# Altium schematic sheet Connector_Section.SchDoc
size A4; DocumentNumber: 6; SheetNumber: 6; SheetTotal: 6
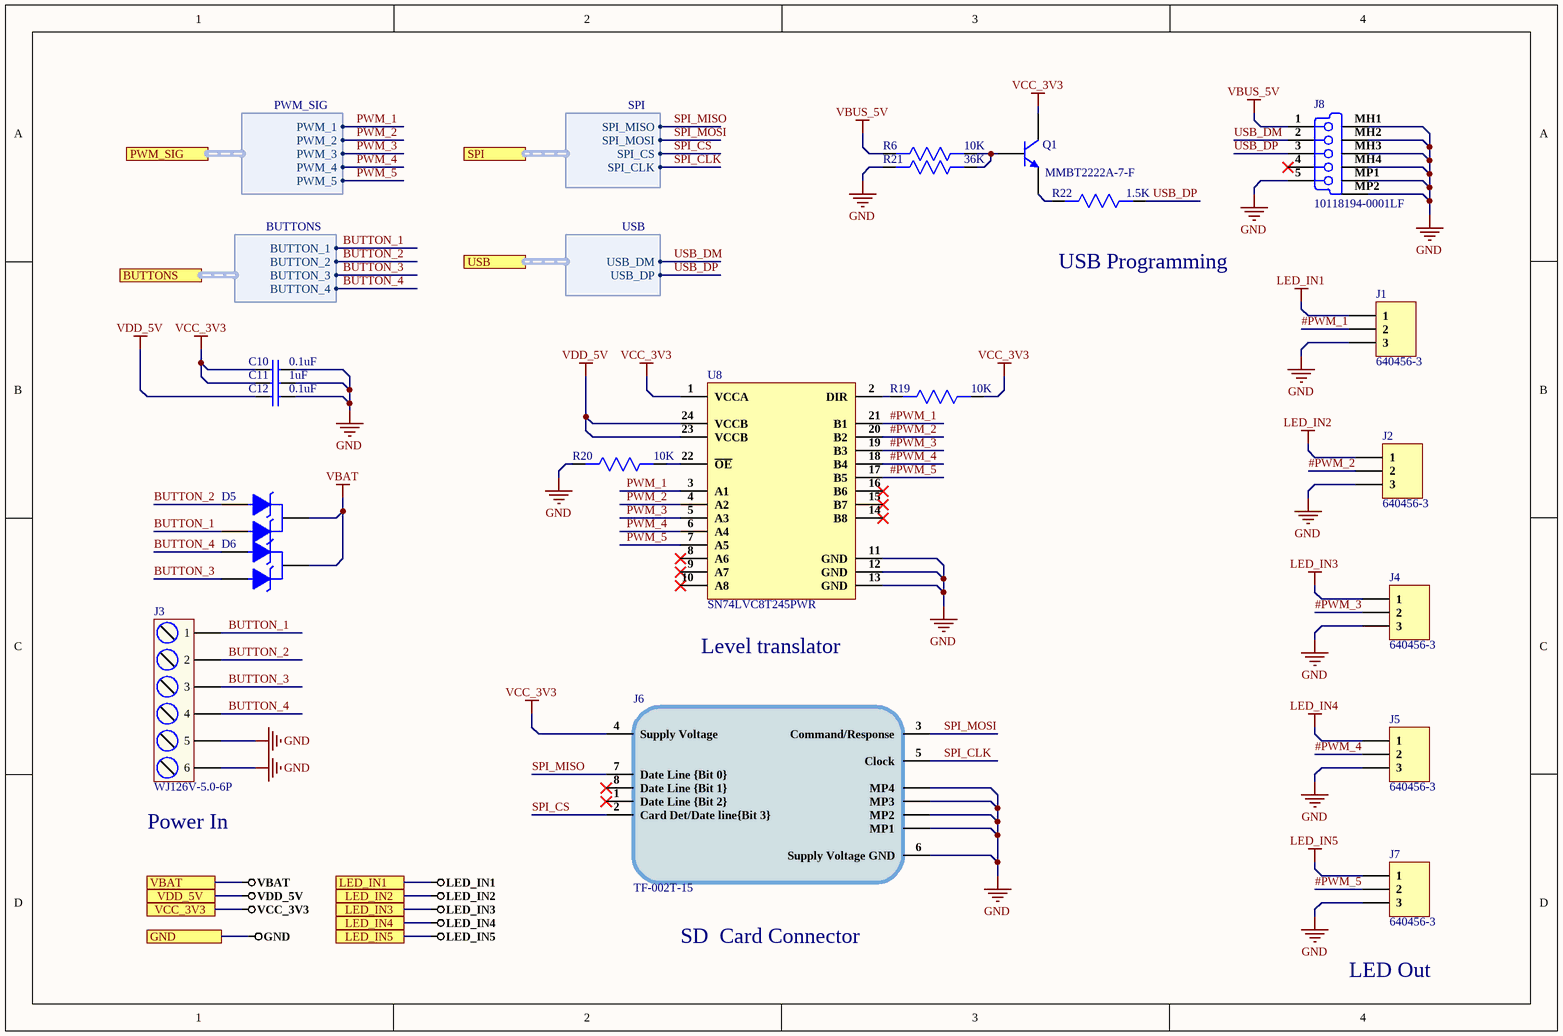
[diagram p0: Connector_Section.SchDoc]

## Parts
C10  0.1uF  [Cap0603]
C11  1uF  [Cap0603]
C12  0.1uF  [Cap0603]
D5  VS-12CWQ06FNTR-M3  [VS-12CWQ06FNTR-M3]  (value not drawn)
D6  VS-12CWQ06FNTR-M3  [VS-12CWQ06FNTR-M3]  (value not drawn)
J1  640456-3  [640456-3]
J2  640456-3  [640456-3]
J3  WJ126V-5.0-6P  [WJ126V-5.0-6P]
J4  640456-3  [640456-3]
J5  640456-3  [640456-3]
J6  TF-002T-15  [TF-002T-15]
J7  640456-3  [640456-3]
J8  10118194-0001LF  [10118194-0001LF]
Q1  MMBT2222A-7-F  [SOT-23]
R6  10K  [Res0603]
R19  10K  [Res0603]
R20  10K  [Res0603]
R21  36K  [Res0603]
R22  1.5K  [Res0603]
U8  SN74LVC8T245PWR  [24-TSSOP]

## Ports
BUTTONS (harness BUTTONS), GND, LED_IN1, LED_IN2, LED_IN3, LED_IN4, LED_IN5, PWM_SIG (harness PWM_SIG), SPI (harness SPI), USB (harness USB), VBAT, VCC_3V3, VDD_5V

## Harnesses
PWM_SIG: PWM_1, PWM_2, PWM_3, PWM_4, PWM_5
SPI: SPI_MISO, SPI_MOSI, SPI_CS, SPI_CLK
USB: USB_DM, USB_DP
BUTTONS: BUTTON_1, BUTTON_2, BUTTON_3, BUTTON_4

## Nets
GND: C10.2 C11.2 C12.2 J1.3 J2.3 J3.5 J3.6 J4.3 J5.3 J6.6(Supply_Voltage_GND) J6.MP1 J6.MP2 J6.MP3 J6.MP4 J7.3 J8.5(GND) J8.MH1(Tab) J8.MH2(Tab) J8.MH3(Tab) J8.MH4(Tab) J8.MP1(Tab) J8.MP2(Tab) R20.2 R21.2 U8.11(GND) U8.12(GND) U8.13(GND) ; port GND
LED_IN1: J1.1 ; port LED_IN1
LED_IN2: J2.1 ; port LED_IN2
LED_IN3: J4.1 ; port LED_IN3
LED_IN4: J5.1 ; port LED_IN4
LED_IN5: J7.1 ; port LED_IN5
VBAT: D5.4(CATHODE) D6.4(CATHODE) ; port VBAT
VBUS_5V: J8.1(V_BUS_(5V)) R6.2
VCC_3V3: C10.1 C11.1 J6.4(Supply_Voltage) Q1.3(C) R19.1 U8.1(VCCA) ; port VCC_3V3
VDD_5V: C12.1 U8.23(VCCB) U8.24(VCCB) ; port VDD_5V
#PWM_1: J1.2 U8.21(B1)
#PWM_2: J2.2 U8.20(B2)
#PWM_3: J4.2 U8.19(B3)
#PWM_4: J5.2 U8.18(B4)
#PWM_5: J7.2 U8.17(B5)
BUTTON_1: D5.3(ANODE) J3.1 ; port BUTTONS.BUTTON_1
BUTTON_2: D5.1(ANODE) J3.2 ; port BUTTONS.BUTTON_2
BUTTON_3: D6.3(ANODE) J3.3 ; port BUTTONS.BUTTON_3
BUTTON_4: D6.1(ANODE) J3.4 ; port BUTTONS.BUTTON_4
PWM_1: U8.3(A1) ; port PWM_SIG.PWM_1
PWM_2: U8.4(A2) ; port PWM_SIG.PWM_2
PWM_3: U8.5(A3) ; port PWM_SIG.PWM_3
PWM_4: U8.6(A4) ; port PWM_SIG.PWM_4
PWM_5: U8.7(A5) ; port PWM_SIG.PWM_5
SPI_CLK: J6.5(Clock) ; port SPI.SPI_CLK
SPI_CS: J6.2(Card_Det/Date_line{Bit_3}) ; port SPI.SPI_CS
SPI_MISO: J6.7(Date_Line_{Bit_0}) ; port SPI.SPI_MISO
SPI_MOSI: J6.3(Command/Response) ; port SPI.SPI_MOSI
USB_DM: J8.2(D-) ; port USB.USB_DM
USB_DP: J8.3(D+) R22.1 ; port USB.USB_DP
NetQ1_1: Q1.1(B) R6.1 R21.1
NetQ1_2: Q1.2(E) R22.2
NetR19_2: R19.2 U8.2(DIR)
NetR20_1: R20.1 U8.22(~{OE})

Not connected (* = marked no-connect by the designer): J6 1(Date_Line_{Bit_2})* 8(Date_Line_{Bit_1})*; J8 4(NC)*; U8 8(A6)* 9(A7)* 10(A8)* 14(B8)* 15(B7)* 16(B6)*

## Notes on the sheet
- (near R22) USB Programming
- Level translator
- (near J3) Power In
- SD  Card Connector
- LED Out

## Library data of the parts
C10 C12 = CC0603KRX7R0BB104: CAP CER 0.1UF 100V X7R 0603; Manufacturer: Yageo; Capacitance: 100nF; Tolerance: 10%; Supplier 1: Digi-Key; Manufacturer Part Number: CC0603KRX7R0BB104; RoHS: Yes; Category: Ceramic Capacitors; Stock 1: 60476; Pricing 1: 1=0.19000, 10=0.13500, 50=0.07680, 100=0.06370, 500=0.04466, 1000=0.03696 (USD); Mount: Surface Mount; Case/Package: 0603; Case Code (Metric): 1608; Case Code (Imperial): 0603; Weight: 7.1E-05oz; Min Operating Temperature: -55°C; Max Operating Temperature: 125°C; Package Quantity: 4000; Voltage Rating: 100V; Packaging: Tape and Reel; Dielectric: X7R; Termination: SMD/SMT; Resistor Type: Ceramic; Voltage Rating (DC): 100V; Series: CC; Length: 0.063inch; Width: 0.031inch; Thickness: 0.035inch; Depth: 0.8mm; Lead Free: Lead Free; RoHS Compliant: Yes; ComponentLink1URL: https://datasheet.ciiva.com/6277/mlccorderingcode-6277030.pdf?src-supplier=Digi-Key; ComponentLink1Description: https://datasheet.ciiva.com/6277/mlccorderingcode-6277030.pdf?src-supplier=Digi-Key; ComponentLink2URL: https://datasheet.ciiva.com/6277/mlccorderingcode-6277081.pdf?src-supplier=Digi-Key; ComponentLink2Description: https://datasheet.ciiva.com/6277/mlccorderingcode-6277081.pdf?src-supplier=Digi-Key; ComponentLink3URL: https://datasheet.ciiva.com/6277/mlccorderingcode-6277082.pdf?src-supplier=Digi-Key; ComponentLink3Description: https://datasheet.ciiva.com/6277/mlccorderingcode-6277082.pdf?src-supplier=Digi-Key; Supplier Part Number 1: 311-1523-1-ND
C11 = CC0603KRX5R8BB105: CAP CER 1UF 25V X5R 0603; Manufacturer: Yageo; Tolerance: 10%; Supplier 1: Digi-Key; Manufacturer Part Number: CC0603KRX5R8BB105; Stock 1: 277068; Pricing 1: 1=0.13, 10=0.093, 100=0.0437, 500=0.03066, 1000=0.02539 (USD); Mount: Surface Mount; Case/Package: 0603; Number of Pins: 2; Case Code (Metric): 1608; Case Code (Imperial): 0603; Min Operating Temperature: -55°C; Max Operating Temperature: 85°C; Capacitance: 1uF; Dielectric: X5R; Package Quantity: 1; Voltage Rating: 25V; Packaging: Tape and Reel; Termination: SMD/SMT; Voltage Rating (DC): 25V; Length: 1.6mm; Height: 0.8mm; Width: 0.031inch; Thickness: 0.035inch; Depth: 0.8mm; Radiation Hardening: No; REACH SVHC: No SVHC; Lead Free: Lead Free; Halogen Free: Halogen Free; ComponentLink1URL: http://www.yageo.com/documents/recent/UPY-GPHC_X5R_4V-to-50V_25.pdf?src-supplier=Digi-Key; ComponentLink1Description: http://www.yageo.com/documents/recent/UPY-GPHC_X5R_4V-to-50V_25.pdf?src-supplier=Digi-Key; ComponentLink2URL: http://www.yageo.com/documents/recent/UPY-GPHC_X5R_4V-to-50V_12.pdf?src-supplier=Avnet+Europe; ComponentLink2Description: http://www.yageo.com/documents/recent/UPY-GPHC_X5R_4V-to-50V_12.pdf?src-supplier=Avnet+Europe; ComponentLink3URL: http://www.farnell.com/datasheets/1525783.pdf?src-supplier=Element14; ComponentLink3Description: http://www.farnell.com/datasheets/1525783.pdf?src-supplier=Element14; ComponentLink4URL: http://www.yageo.com/documents/recent/UPY-GPHC_X5R_4V-to-50V_12.pdf?src-supplier=Avnet; ComponentLink4Description: http://www.yageo.com/documents/recent/UPY-GPHC_X5R_4V-to-50V_12.pdf?src-supplier=Avnet; Supplier Part Number 1: 311-1445-6-ND
D5 D6 = VS-12CWQ06FNTR-M3: Schottky Rectifier, 60 V, 12 A, Dual Common Cathode, TO-252AA; Manufacturer: Vishay Semiconductors; Forward Voltage: 790mV; Forward Current: 12A; Max Reverse Current: 3mA; Average Rectified Current: 6A; Max Repetitive Reverse Voltage (Vrrm): 60V; Peak Non-Repetitive Surge Current: 320A; Supplier 1: Avnet; Manufacturer Part Number: VS-12CWQ06FNTR-M3; RoHS: Yes; Category: Rectifier Diodes; Stock 1: 119; Pricing 1: 1=1.14000, 10=1.03000, 25=0.97800, 50=0.92000, 100=0.86500, 250=0.81400, 500=0.77000 (USD); Mount: Surface Mount; Case/Package: TO-252AA; Number of Pins: 3; Min Operating Temperature: -55°C; Max Operating Temperature: 150°C; Packaging: Tape and Reel; Element Configuration: Common Cathode; Max Forward Surge Current (Ifsm): 320A; Max Reverse Voltage (DC): 60V; Series: -; REACH SVHC: No SVHC; RoHS Compliant: Yes; ComponentLink1URL: https://datasheet.ciiva.com/8289/12cwq06f-8289149.pdf?src-supplier=Avnet; ComponentLink1Description: https://datasheet.ciiva.com/8289/12cwq06f-8289149.pdf?src-supplier=Avnet; Supplier Part Number 1: 99Y8339
J1 J2 J4 J5 J7 = 640456-3: CONN HEADER VERT 3POS 2.54MM; Manufacturer: TE Connectivity; Number of Positions: 3; Voltage Rating: 250V; Connector Type: Connector,Pin,Plug,Header; Connector System: Wire-to-Board; Contact Retention: No (Without); Contact Current Rating: 5A; PCB Mount Retention: Without; Contact Resistance: 6mR; PCB Mounting Orientation: Vertical; Gender: Male; Contact Style: Straight; Circuit Application: Signal; Mating Connector Lock: Yes (With); PCB Thickness: 0.063inch; Plating Thickness: 3.81um; Contact Post Length: 3.56mm; Tail Length: 0.14inch; Approvals: CSA; Supplier 1: RSComponents; Manufacturer Part Number: 640456-3; RoHS: Yes; Category: Connectors; Stock 1: 8977; Pricing 1: 250=0.08100, 1000=0.07000, 5000=0.05800, 10000=0.05400 (GBP); Mount: Through Hole; Contact Plating: Tin; Housing Color: Natural; Housing Material: Polyester; Contact Material: Copper Alloy; Color: Beige,White; Contact Shape: Square; Contact Finish - Mating: TIN; Insulation Material: Thermoplastic; Insulation Color: Natural; Min Operating Temperature: -67°C; Max Operating Temperature: 221°C; Number of Rows: 1; Packaging: Bulk; Package Quantity: 5000; Termination: Solder; Number of Contacts: 3; Orientation: Straight; Max Voltage Rating (AC): 250V; Contact Gender: Male; Mating Alignment: No (Without); Mating Retention: No (Without); PCB Mount Alignment: No (Without); Sealable: No (Without); Current Rating: 5A; Strain Relief: No (Without); Backwall/Post Interruptions: No (Without); Shrouded: No (Without); Fastening Type: Friction; Voltage Rating (AC): 250V; Series: MTA-100; Contact Type: Male Pin; Panel Mount Retention: No (Without); Mounting Ears: No (Without); Length: 0.4inch; Height: 7.87mm; Pitch: 2.54mm; Depth: 5.72mm; Contact Mating Length: 7.49mm; Radiation Hardening: No; Flammability Rating: UL94 V-0; REACH SVHC: Unknown; Lead Free: Lead Free; ELV: Compliant; RoHS Compliant: Yes; ComponentLink1URL: https://datasheet.ciiva.com/11746/0900766b80027008-11746172.pdf?src-supplier=RSComponents; ComponentLink1Description: https://datasheet.ciiva.com/11746/0900766b80027008-11746172.pdf?src-supplier=RSComponents; ComponentLink2URL: https://datasheet.ciiva.com/6005/1712135-6005440.pdf?src-supplier=Farnell; ComponentLink2Description: https://datasheet.ciiva.com/6005/1712135-6005440.pdf?src-supplier=Farnell; ComponentLink3URL: https://datasheet.ciiva.com/19474/613940-19474164.pdf?src-supplier=Jameco; ComponentLink3Description: https://datasheet.ciiva.com/19474/613940-19474164.pdf?src-supplier=Jameco; ComponentLink4URL: https://datasheet.ciiva.com/16456/eng-ds-82056-mta-0608-16456886.pdf?src-supplier=Future+Electronics; ComponentLink4Description: https://datasheet.ciiva.com/16456/eng-ds-82056-mta-0608-16456886.pdf?src-supplier=Future+Electronics; ComponentLink5URL: https://datasheet.ciiva.com/14156/04384301-14156821.pdf?src-supplier=Distrelec; ComponentLink5Description: https://datasheet.ciiva.com/14156/04384301-14156821.pdf?src-supplier=Distrelec; ComponentLink6URL: https://datasheet.ciiva.com/16656/eng-ds-82056-mta-0608-16656523.pdf?src-supplier=Avnet+Europe; ComponentLink6Description: https://datasheet.ciiva.com/16656/eng-ds-82056-mta-0608-16656523.pdf?src-supplier=Avnet+Europe; ComponentLink7URL: https://datasheet.ciiva.com/30127/8852eng-ds-82056-mta-0608-30127480.pdf?src-supplier=Onlinecomponents.com; ComponentLink7Description: https://datasheet.ciiva.com/30127/8852eng-ds-82056-mta-0608-30127480.pdf?src-supplier=Onlinecomponents.com; ComponentLink8URL: https://datasheet.ciiva.com/14637/70083643-14637750.pdf?src-supplier=Allied+Electronics; ComponentLink8Description: https://datasheet.ciiva.com/14637/70083643-14637750.pdf?src-supplier=Allied+Electronics; ComponentLink9URL: https://datasheet.ciiva.com/7128/eng-ds-82056-mta-0608-7128744.pdf?src-supplier=Newark; ComponentLink9Description: https://datasheet.ciiva.com/7128/eng-ds-82056-mta-0608-7128744.pdf?src-supplier=Newark; ComponentLink10URL: https://datasheet.ciiva.com/709/eng-cd-640456-w2-709688.pdf?src-supplier=Digi-Key; ComponentLink10Description: https://datasheet.ciiva.com/709/eng-cd-640456-w2-709688.pdf?src-supplier=Digi-Key; Supplier Part Number 1: 1320361P
J3 = WJ126V-5.0-6P: P=5.0mm Screw terminal ROHS; Manufacturer: Ningbo Kangnex Elec; Manufacturer Part No: WJ126V-5.0-6P; Package: Custom; ComponentLink1Description: LCSC; ComponentLink1URL: https://www.lcsc.com/product-detail/Screw-span-style-background-color-ff0-terminal-span_Ningbo-Kangnex-Elec-WJ126V-5-0-6P_C8379.html
J6 = TF-002T-15: SD Card Connector SMD; Manufacturer: SOFNG; Card Type: MicroSD; Card Connection Mode: Pluggable; ComponentLink1Description: LCSC; ComponentLink1URL: https://lcsc.com/product-detail/SD-Card-Connectors_SOFNG-TF-002T-15_C125616.html
J8 = 10118194-0001LF: CONN RCPT USB2.0 MICRO B SMD R/A; Manufacturer: Amphenol FCI; Gender: Receptacle; Current Rating: 1.8A; Connector Type: USB,Receptacle; Number of Contacts: 5; Insulation Resistance: 1GR; Number of Ports: 1; Max Voltage Rating (AC): 100V; Pitch: 0.65mm; Supplier 1: Digi-Key; Manufacturer Part Number: 10118194-0001LF; Stock 1: 35943; Pricing 1: 1=0.43, 10=0.405, 25=0.3648, 50=0.3242, 100=0.3107, 250=0.28368, 500=0.27016 (USD); Mount: Surface Mount,Horizontal; Color: Black; Contact Material: Copper Alloy; Contact Plating: Gold; Number of Terminals: 5; Housing Material: Polymer; Min Operating Temperature: -55°C; Max Operating Temperature: 85°C; Package Quantity: 9600; Packaging: Tape and Reel; Termination: Solder; Orientation: Right Angle; Features: Shielded; Length: 8.05mm; Depth: 5mm; Radiation Hardening: No; Lead Free: Lead Free; Flammability Rating: UL94 V-0; ComponentLink1URL: http://www.amphenol-icc.com/media/wysiwyg/files/drawing/10118194.pdf?src-supplier=Digi-Key; ComponentLink1Description: http://www.amphenol-icc.com/media/wysiwyg/files/drawing/10118194.pdf?src-supplier=Digi-Key; ComponentLink2URL: https://cdn.amphenol-icc.com/media/wysiwyg/files/drawing/10118194.pdf?src-supplier=Mouser; ComponentLink2Description: https://cdn.amphenol-icc.com/media/wysiwyg/files/drawing/10118194.pdf?src-supplier=Mouser; ComponentLink3URL: https://cdn.amphenol-icc.com/media/wysiwyg/files/drawing/10118194.pdf?src-supplier=Verical; ComponentLink3Description: https://cdn.amphenol-icc.com/media/wysiwyg/files/drawing/10118194.pdf?src-supplier=Verical; Supplier Part Number 1: 609-4618-1-ND
Q1 = MMBT2222A-7-F: TRANS NPN 40V 0.6A SMD SOT23-3; Manufacturer: Diodes; Max Power Dissipation: 300mW; Collector Base Voltage (VCBO): 75V; Max Collector Current: 600mA; hFE Min: 100; Frequency: 300MHz; Number of Elements: 1; Emitter Base Voltage (VEBO): 6V; Collector Emitter Saturation Voltage: 1V; Power Dissipation: 350mW; Element Configuration: Single; Current: 1A; Supplier 1: Digi-Key; Manufacturer Part Number: MMBT2222A-7-F; Stock 1: 2471182; Pricing 1: 1=0.15, 10=0.134, 100=0.0729, 500=0.04486, 1000=0.03059 (USD); Mount: Surface Mount; Case/Package: SOT-23; Number of Pins: 3; Weight: 0.000282oz; Contact Plating: Matte,Tin; Min Operating Temperature: -55°C; Max Operating Temperature: 150°C; Packaging: Tape and Reel; Collector Emitter Voltage (VCEO): 40V; Polarity: NPN; Voltage Rating (DC): 40V; Package Quantity: 3000; Continuous Collector Current: 600mA; Collector Emitter Breakdown Voltage: 40V; Transition Frequency: 300MHz; Max Breakdown Voltage: 40V; Max Frequency: 300MHz; Termination: SMD/SMT; Gain Bandwidth Product: 300MHz; Current Rating: 600mA; Voltage: 40V; Length: 3.05mm; Height: 1mm; Width: 1.4mm; Radiation Hardening: No; Lead Free: Lead Free; REACH SVHC: No SVHC; ComponentLink1URL: http://www.diodes.com/datasheets/ds30041.pdf?src-supplier=Future+Electronics; ComponentLink1Description: http://www.diodes.com/datasheets/ds30041.pdf?src-supplier=Future+Electronics; ComponentLink2URL: http://www.diodes.com/datasheets/ds30041.pdf?src-supplier=Avnet; ComponentLink2Description: http://www.diodes.com/datasheets/ds30041.pdf?src-supplier=Avnet; ComponentLink3URL: https://www.verical.com/server-webapp/html/getDatasheet?partID=82692&src-supplier=Verical; ComponentLink3Description: https://www.verical.com/server-webapp/html/getDatasheet?partID=82692&src-supplier=Verical; ComponentLink4URL: https://www.diodes.com/assets/Datasheets/ds30041.pdf?src-supplier=Digi-Key; ComponentLink4Description: https://www.diodes.com/assets/Datasheets/ds30041.pdf?src-supplier=Digi-Key; ComponentLink5URL: http://www.diodes.com/datasheets/ds30041.pdf?src-supplier=Avnet+Europe; ComponentLink5Description: http://www.diodes.com/datasheets/ds30041.pdf?src-supplier=Avnet+Europe; ComponentLink6URL: http://www.diodes.com/datasheets/ds30041.pdf?src-supplier=Element14; ComponentLink6Description: http://www.diodes.com/datasheets/ds30041.pdf?src-supplier=Element14; Supplier Part Number 1: MMBT2222A-FDIDKR-ND
R6 R19 R20 = RC0603FR-0710KL: RES SMD 10K OHM 1% 1/10W 0603; Manufacturer: Yageo; Resistance: 10kR; Temperature Coefficient: 100ppm/°C; Voltage Rating (DC): 50V; Power Rating: 100mW; Voltage Rating: 75V; Supplier 1: Digi-Key; Manufacturer Part Number: RC0603FR-0710KL; Stock 1: 144725424; Pricing 1: 1=0.1, 10=0.024, 100=0.0097, 1000=0.00437, 2500=0.00379 (USD); Case/Package: 0603; Number of Pins: 2; Weight: 7.1E-05oz; Case Code (Imperial): 0603; Case Code (Metric): 1608; Min Operating Temperature: -55°C; Max Operating Temperature: 155°C; Tolerance: 1%; Composition: Thick Film; Packaging: Tape and Reel; Military Standard: Not; Termination: SMD/SMT; Length: 1.6mm; Height: 0.45mm; Width: 0.8mm; Depth: 0.8mm; Lead Pitch: 0.3mm; REACH SVHC: No SVHC; Lead Free: Lead Free; ComponentLink1URL: http://www.farnell.com/datasheets/38590.pdf?src-supplier=Element14; ComponentLink1Description: http://www.farnell.com/datasheets/38590.pdf?src-supplier=Element14; ComponentLink2URL: https://www.verical.com/server-webapp/html/getDatasheet?partID=409289&src-supplier=Verical; ComponentLink2Description: https://www.verical.com/server-webapp/html/getDatasheet?partID=409289&src-supplier=Verical; ComponentLink3URL: http://www.farnell.com/datasheets/1868787.pdf?src-supplier=Element14; ComponentLink3Description: http://www.farnell.com/datasheets/1868787.pdf?src-supplier=Element14; ComponentLink4URL: http://www.farnell.com/datasheets/2167052.pdf?src-supplier=Element14; ComponentLink4Description: http://www.farnell.com/datasheets/2167052.pdf?src-supplier=Element14; ComponentLink5URL: http://www.farnell.com/datasheets/443971.pdf?src-supplier=Element14; ComponentLink5Description: http://www.farnell.com/datasheets/443971.pdf?src-supplier=Element14; Supplier Part Number 1: 311-10.0KHRDKR-ND
R21 = RC0603FR-0736KL: RES SMD 36K Ohm 1% 0.1W 0603; Manufacturer: Yageo; Resistance: 36kR; Power Rating: 100mW; Temperature Coefficient: 100ppm/°C; Voltage Rating (DC): 50V; Voltage Rating: 75V; Supplier 1: Digi-Key; Manufacturer Part Number: RC0603FR-0736KL; RoHS: Yes; Category: Chip SMD Resistors; Stock 1: 463498; Pricing 1: 1=0.10000, 10=0.02400, 100=0.00970, 1000=0.00436, 2500=0.00378 (USD); Mount: Surface Mount; Case/Package: 0603; Case Code (Metric): 1608; Case Code (Imperial): 0603; Weight: 7.1E-05oz; Size Code: 0603; Min Operating Temperature: -55°C; Max Operating Temperature: 155°C; Tolerance: 1%; Packaging: Tape and Reel; Package Quantity: 1; Resistor Type: Thick Film; Number of Terminations: 2; Termination: SMD/SMT; Max Power Dissipation: 100mW; Features: Moisture Resistant; Series: RC; Construction: Rectangular; Length: 1.6mm; Width: 0.031inch; Height: 0.022inch; Depth: 0.8mm; Lead Free: Lead Free; Military Standard: Not; RoHS Compliant: Yes; ComponentLink1URL: https://datasheet.ciiva.com/2454/pyu-r-int-thick-7-2454483.pdf?src-supplier=Digi-Key; ComponentLink1Description: https://datasheet.ciiva.com/2454/pyu-r-int-thick-7-2454483.pdf?src-supplier=Digi-Key; ComponentLink2URL: https://datasheet.ciiva.com/2454/pyu-r-int-thick-7-2454484.pdf?src-supplier=Digi-Key; ComponentLink2Description: https://datasheet.ciiva.com/2454/pyu-r-int-thick-7-2454484.pdf?src-supplier=Digi-Key; ComponentLink3URL: https://datasheet.ciiva.com/2454/pyu-r-int-thick-7-2454485.pdf?src-supplier=Digi-Key; ComponentLink3Description: https://datasheet.ciiva.com/2454/pyu-r-int-thick-7-2454485.pdf?src-supplier=Digi-Key; Supplier Part Number 1: 311-36.0KHRCT-ND
R22 = RC0603FR-071K5L: RES SMD 1.5K OHM 1% 1/10W 0603
U8 = SN74LVC8T245PWR: IC TRANSLATION TXRX 5.5V 24TSSOP; Manufacturer: Texas Instruments; Logic Function: Translator,Transceiver; Propagation Delay: 4.2ns; Direction: Bidirectional; Min Supply Voltage: 1.65V; Number of Bits: 8; High Level Output Current: -32mA; Low Level Output Current: 32mA; Quiescent Current: 15uA; Number of Elements: 1; Data Rate: 500Mbps; Turn-On Delay Time: 32.2ns; Polarity: Non-Inverting; Operating Supply Voltage: 3.3V; ComponentLink1URL: https://datasheet.ciiva.com/1899/sn74lvc8t245-ep-1899655.pdf?src-supplier=Digi-Key; ComponentLink1Description: https://datasheet.ciiva.com/1899/sn74lvc8t245-ep-1899655.pdf?src-supplier=Digi-Key; ComponentLink2URL: https://datasheet.ciiva.com/1628/1636538-1628674.pdf?src-supplier=Newark; ComponentLink2Description: https://datasheet.ciiva.com/1628/1636538-1628674.pdf?src-supplier=Newark; ComponentLink3URL: https://datasheet.ciiva.com/15086/getdatasheetpartid-299102-15086582.pdf?src-supplier=Verical; ComponentLink3Description: https://datasheet.ciiva.com/15086/getdatasheetpartid-299102-15086582.pdf?src-supplier=Verical; ComponentLink4URL: https://datasheet.ciiva.com/26868/sn74lvc8t245mpwrep-26868235.pdf?src-supplier=IIIC; ComponentLink4Description: https://datasheet.ciiva.com/26868/sn74lvc8t245mpwrep-26868235.pdf?src-supplier=IIIC; ComponentLink5URL: https://datasheet.ciiva.com/1899/sn74lvc8t245-ep-1899656.pdf?src-supplier=Digi-Key; ComponentLink5Description: https://datasheet.ciiva.com/1899/sn74lvc8t245-ep-1899656.pdf?src-supplier=Digi-Key; ComponentLink6URL: https://datasheet.ciiva.com/1899/sn74lvc8t245-ep-1899657.pdf?src-supplier=Digi-Key; ComponentLink6Description: https://datasheet.ciiva.com/1899/sn74lvc8t245-ep-1899657.pdf?src-supplier=Digi-Key; ComponentLink7URL: https://datasheet.ciiva.com/25972/sn74lvc8t245-ep-25972059.pdf?src-supplier=Avnet+Europe; ComponentLink7Description: https://datasheet.ciiva.com/25972/sn74lvc8t245-ep-25972059.pdf?src-supplier=Avnet+Europe; Supplier 1: Digi-Key; Manufacturer Part Number: SN74LVC8T245PWR; RoHS: Yes; Category: Buffers, Drivers and Transceivers; Pricing 1: 1=1.26000, 10=1.12600, 25=1.06840, 100=0.87770, 250=0.82044, 500=0.66780, 1000=0.63000 (USD); Mount: Surface Mount; Case/Package: TSSOP; Number of Pins: 24; Weight: 0.003157oz; Contact Plating: Gold; Min Operating Temperature: -40°C; Max Operating Temperature: 85°C; Package Quantity: 1; Packaging: Tape and Reel; Max Supply Voltage: 5.5V; Number of Outputs: 8; Number of Channels: 8; Length: 7.9mm; Width: 4.5mm; Height: 1.05mm; Radiation Hardening: No; Lead Free: Lead Free; REACH SVHC: No SVHC; ComponentLink8URL: https://datasheet.ciiva.com/34301/1048559-34301923.pdf?src-supplier=Jameco; ComponentLink8Description: https://datasheet.ciiva.com/34301/1048559-34301923.pdf?src-supplier=Jameco; ComponentLink9URL: https://datasheet.ciiva.com/15086/getdatasheetpartid-48801-15086005.pdf?src-supplier=Verical; ComponentLink9Description: https://datasheet.ciiva.com/15086/getdatasheetpartid-48801-15086005.pdf?src-supplier=Verical; ComponentLink10URL: https://datasheet.ciiva.com/41455/001017232-da-01-en-ic-bus-8bit-sn74lvc8t245pwr-tssop-24-tid-41455868.pdf?src-supplier=Conrad; ComponentLink10Description: https://datasheet.ciiva.com/41455/001017232-da-01-en-ic-bus-8bit-sn74lvc8t245pwr-tssop-24-tid-41455868.pdf?src-supplier=Conrad; ComponentLink11URL: https://datasheet.ciiva.com/26867/sn74lvc8t245pwr-26867745.pdf?src-supplier=IIIC; ComponentLink11Description: https://datasheet.ciiva.com/26867/sn74lvc8t245pwr-26867745.pdf?src-supplier=IIIC; ComponentLink12URL: https://datasheet.ciiva.com/7795/1763937-7795013.pdf?src-supplier=Element14; ComponentLink12Description: https://datasheet.ciiva.com/7795/1763937-7795013.pdf?src-supplier=Element14; ComponentLink13URL: https://datasheet.ciiva.com/46439/1831204-46439647.pdf?src-supplier=Element14; ComponentLink13Description: https://datasheet.ciiva.com/46439/1831204-46439647.pdf?src-supplier=Element14; ComponentLink14URL: https://datasheet.ciiva.com/1899/sn74lvc8t245-1899396.pdf?src-supplier=Digi-Key; ComponentLink14Description: https://datasheet.ciiva.com/1899/sn74lvc8t245-1899396.pdf?src-supplier=Digi-Key; ComponentLink15URL: https://datasheet.ciiva.com/1899/sn74lvc8t245-1899395.pdf?src-supplier=Digi-Key; ComponentLink15Description: https://datasheet.ciiva.com/1899/sn74lvc8t245-1899395.pdf?src-supplier=Digi-Key; ComponentLink16URL: https://datasheet.ciiva.com/1899/sn74lvc8t245-1899397.pdf?src-supplier=Digi-Key; ComponentLink16Description: https://datasheet.ciiva.com/1899/sn74lvc8t245-1899397.pdf?src-supplier=Digi-Key; ComponentLink17URL: https://datasheet.ciiva.com/25973/sn74lvc8t245-25973803.pdf?src-supplier=Avnet+Europe; ComponentLink17Description: https://datasheet.ciiva.com/25973/sn74lvc8t245-25973803.pdf?src-supplier=Avnet+Europe; Supplier Part Number 1: 296-18593-1-ND